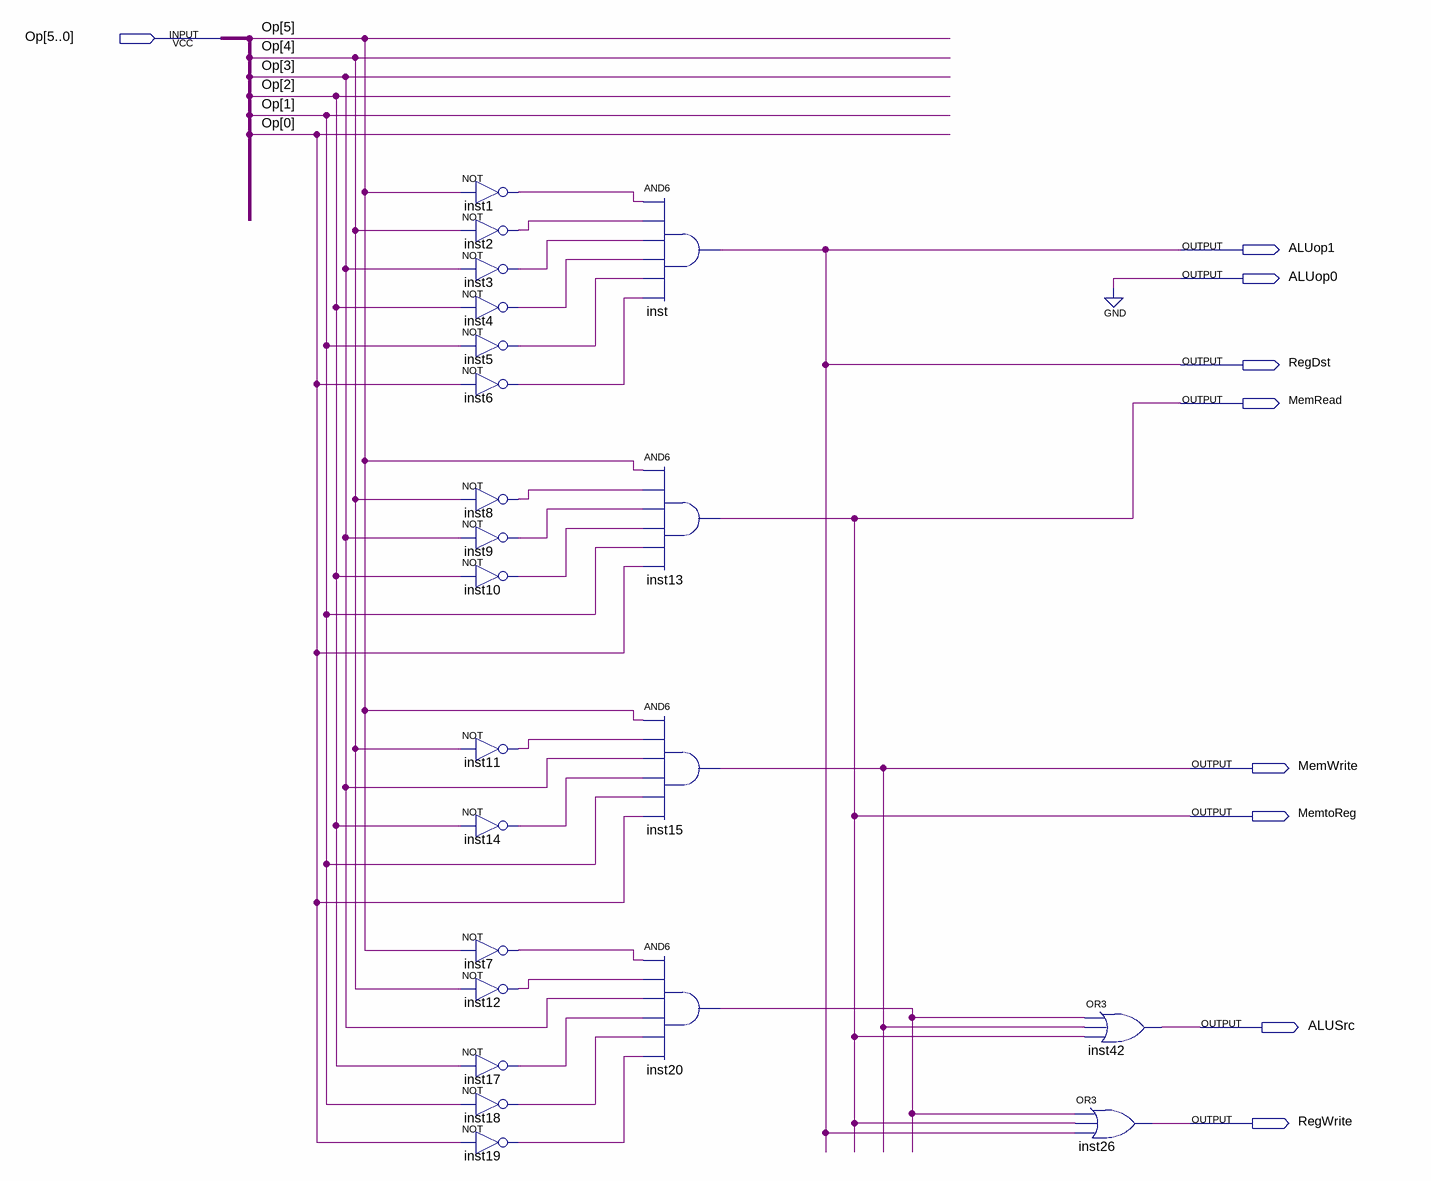
[diagram p0: schematic sheet]
// Quartus schematic Control_Unit.bdf as structural Verilog: 22 symbols, 9 pins
module Control_Unit (
  input  [5:0] Op,
  output ALUop1,
  output ALUop0,
  output RegDst,
  output MemRead,
  output MemWrite,
  output MemtoReg,
  output ALUSrc,
  output RegWrite
);

  wire inst1_out, inst2_out, inst3_out, inst4_out, inst5_out, inst6_out, inst7_out, inst8_out, inst9_out,
       inst10_out, inst11_out, inst12_out, inst14_out, inst17_out, inst18_out, inst19_out, inst20_out;

  not inst1 (inst1_out, Op[5]);
  not inst2 (inst2_out, Op[4]);
  not inst3 (inst3_out, Op[3]);
  not inst4 (inst4_out, Op[2]);
  not inst5 (inst5_out, Op[1]);
  not inst6 (inst6_out, Op[0]);
  not inst8 (inst8_out, Op[4]);
  not inst9 (inst9_out, Op[3]);
  not inst10 (inst10_out, Op[2]);
  not inst11 (inst11_out, Op[4]);
  not inst14 (inst14_out, Op[2]);
  not inst7 (inst7_out, Op[5]);
  not inst12 (inst12_out, Op[4]);
  not inst17 (inst17_out, Op[2]);
  not inst18 (inst18_out, Op[1]);
  not inst19 (inst19_out, Op[0]);
  and inst (ALUop1, inst1_out, inst2_out, inst3_out, inst4_out, inst5_out, inst6_out);
  and inst13 (MemRead, Op[5], inst8_out, inst9_out, inst10_out, Op[1], Op[0]);
  and inst15 (MemWrite, Op[5], inst11_out, Op[3], inst14_out, Op[1], Op[0]);
  and inst20 (inst20_out, inst7_out, inst12_out, Op[3], inst17_out, inst18_out, inst19_out);
  or inst42 (ALUSrc, inst20_out, MemWrite, MemRead);
  or inst26 (RegWrite, inst20_out, MemRead, ALUop1);

  assign ALUop0 = 1'b0;
  assign MemtoReg = MemRead;
  assign RegDst = ALUop1;
endmodule
